# Altium schematic sheet Top-Sheet.SchDoc
size A4; SheetNumber: 1; SheetTotal: 3
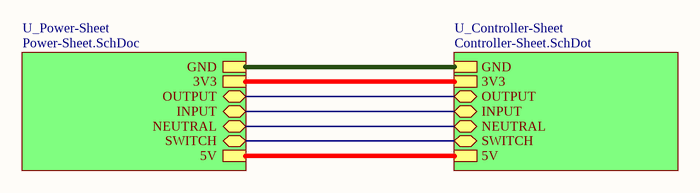
[diagram p0: Top-Sheet.SchDoc]

## Sub-sheets
U_Controller-Sheet = Controller-Sheet.SchDot: GND, 3V3, OUTPUT (bidir), INPUT (bidir), NEUTRAL (bidir), SWITCH (bidir), 5V
U_Power-Sheet = Power-Sheet.SchDoc: 3V3, GND, 5V, OUTPUT (bidir), SWITCH (bidir), INPUT (bidir), NEUTRAL (bidir)

## Nets
(unnamed): sheet U_Power-Sheet/3V3, sheet U_Controller-Sheet/3V3
(unnamed): sheet U_Power-Sheet/GND, sheet U_Controller-Sheet/GND
(unnamed): sheet U_Power-Sheet/5V, sheet U_Controller-Sheet/5V
(unnamed): sheet U_Power-Sheet/OUTPUT, sheet U_Controller-Sheet/OUTPUT
(unnamed): sheet U_Power-Sheet/SWITCH, sheet U_Controller-Sheet/SWITCH
(unnamed): sheet U_Power-Sheet/INPUT, sheet U_Controller-Sheet/INPUT
(unnamed): sheet U_Power-Sheet/NEUTRAL, sheet U_Controller-Sheet/NEUTRAL

## Notes on the sheet
- File:
- Title:
- Date:
- Page
- Num:
- Total:
- Drawn By: Huzaifa Ali